# Altium schematic sheet Input Stage.SchDoc
size A4; SheetNumber: 1; SheetTotal: 4
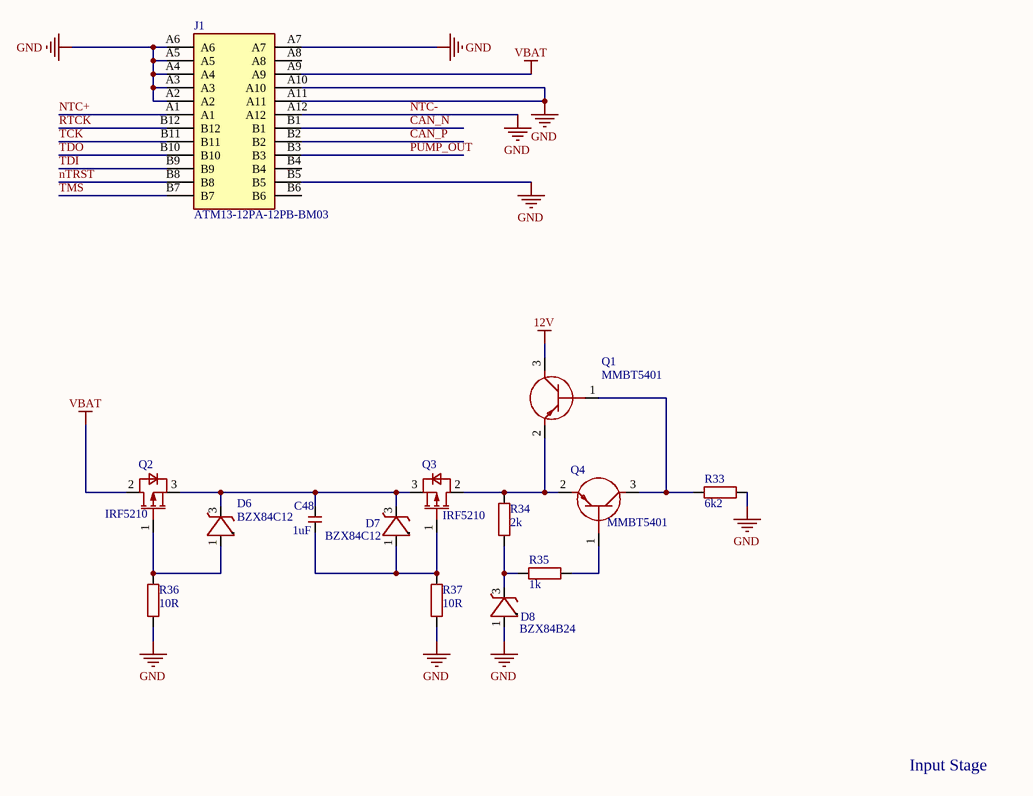
[diagram p0: Input Stage.SchDoc]

## Parts
C48  1uF  [C0402]
D6  BZX84C12  [SOT96P237X111-3N]
D7  BZX84C12  [SOT96P237X111-3N]
D8  BZX84B24  [TRANS_BZX84_ROM-M]
J1  ATM13-12PA-12PB-BM03  [ATM1312PA12PBBM03]
Q1  MMBT5401  [SOT95P240X120-3N]
Q2  IRF5210  [TO254P1528X508-4_3N-V1]
Q3  IRF5210  [TO254P1528X508-4_3N-V1]
Q4  MMBT5401  [SOT95P240X120-3N]
R33  6k2  [R0402]
R34  2k  [R0402]
R35  1k  [R0402]
R36  10R  [R0402]
R37  10R  [R0402]

## Nets
12V: Q1.3(C)
GND: D8.1(A) J1.A2 J1.A3 J1.A4 J1.A5 J1.A6 J1.A7 J1.A10 J1.A11 J1.A12 J1.B5 R33.2 R36.1 R37.1
VBAT: J1.A9 Q2.2(DRAIN)
CAN_N: J1.B1
CAN_P: J1.B2
NTC+: J1.A1
nTRST: J1.B8
PUMP_OUT: J1.B3
RTCK: J1.B12
TCK: J1.B11
TDI: J1.B9
TDO: J1.B10
TMS: J1.B7
NetC48_1: C48.1 D7.1(A) Q3.1(GATE) R37.2
NetC48_2: C48.2 D6.3(K) D7.3(K) Q2.3(SOURCE) Q3.3(SOURCE)
NetD6_1: D6.1(A) Q2.1(GATE) R36.2
NetD8_3: D8.3(K) R34.1 R35.1
NetQ1_1: Q1.1(B) Q4.3(C) R33.1
NetQ1_2: Q1.2(E) Q3.2(DRAIN) Q4.2(E) R34.2
NetQ4_1: Q4.1(B) R35.2

Not connected (* = marked no-connect by the designer): D6 2(NC); D7 2(NC); D8 2(NC); J1 A8 B4 B6

## Notes on the sheet
- NTC-
- Input Stage

## Library data of the parts
C48 = C0402C105K4PAC7411: Ceramic Capacitor, Multilayer, Ceramic, 16V, 10% +Tol, 10% -Tol, X5R, 15% TC, 1uF, Surface Mount, 0402; Manufacturer: KEMET; Multilayer: Yes; Supplier: Mouser; Supplier Part Number: 80-C0402C105K4P7411; Manufacturer Part Number: C0402C105K4PAC7411; RoHS: Yes; Category: Ceramic Capacitors; Stock: 78488; Pricing: 1=0.11, 10=0.061, 50=0.061, 100=0.037, 1000=0.024, 10000=0.019 (USD); Mounting Technology: Surface Mount; Pins: 2; Dielectric Material: Ceramic; Package Shape: Rectangular; Case/Package: 0402; Min Operating Temperature: -55°C; Max Operating Temperature: 85°C; Value: 1uF; Capacitor Type: Ceramic; Tolerance  (fill in as +-): 10%; Packaging: Tape and Reel; Tolerance (fill in as +-): 10%; Rated DC Voltage (URdc): 16V; Temperature Characteristics Code: X5R; Termination: Wraparound; Reach SVHC Compliant: Yes; RoHS Compliant: Yes; ComponentLink1URL: https://datasheet.ciiva.com:443/pdfs/VipMasterIC/IC/KEME/KEME-S-A0008991665/KEME-S-A0008991665-1.pdf?src-supplier=IHS+Markit; ComponentLink1Description: https://datasheet.ciiva.com:443/pdfs/VipMasterIC/IC/KEME/KEME-S-A0008991665/KEME-S-A0008991665-1.pdf?src-supplier=IHS+Markit; ComponentLink2URL: https://api.kemet.com/component-edge/download/datasheet/C0402C105K4PAC7411.pdf?src-supplier=Digikey; ComponentLink2Description: https://api.kemet.com/component-edge/download/datasheet/C0402C105K4PAC7411.pdf?src-supplier=Digikey; ComponentLink3URL: https://datasheet.octopart.com/C0402C105K4PAC7411-KEMET-datasheet-142027389.pdf?src-supplier=Farnell; ComponentLink3Description: https://datasheet.octopart.com/C0402C105K4PAC7411-KEMET-datasheet-142027389.pdf?src-supplier=Farnell
D6 D7 = BZX84C12LT1G: Zener Diode, 12V V(Z), 5.39%, 0.25W, Silicon, Unidirectional, TO-236AB; Manufacturer: ON Semiconductor; Package Body Material: Plastic; Dynamic Impedance-Max: 25R; Number of Elements: 1; Max Power Dissipation: 250mW; Test Current: 5mA; Additional Feature: UL RECOGNIZED; Time @ Peak Reflow Temperature-Max (s): 40s; Qualification Status: Not Qualified; Supplier: Mouser; Supplier Part Number: 863-BZX84C12LT1G; Manufacturer Part Number: BZX84C12LT1G; RoHS: Yes; Category: Zener Diodes; Stock: 46689; Pricing: 1=0.1, 10=0.057, 50=0.057, 100=0.027, 1000=0.026, 10000=0.012 (USD); Pins: 3; Diode Element Material: SILICON; Package Shape: Rectangular; Terminal Finish: Tin; Min Operating Temperature: -65°C; Max Operating Temperature: 150°C; Diode Type: ZENER; Reference Voltage-Nom: 12V; Surface Mount: Yes; Voltage Tol-Max: 5.39%; JESD-609 Code: e3; Polarity: Unidirectional; JESD-30 Code: R-PDSO-G3; Moisture Sensitivity Level: 1; Package Style: SMALL OUTLINEMeter; Technology: ZENER; Terminal Form: Gull Wing; Terminal Position: DUAL; Peak Reflow Temperature (Cel): 260°C; RoHS Compliant: Yes; Reach SVHC Compliant: Yes; JEDEC-95 Code: TO-236AB; ComponentLink1URL: https://datasheet.ciiva.com:443/pdfs/VipMasterIC/IC/ONSM/ONSM-S-A0002809012/ONSM-S-A0002809012-1.pdf?src-supplier=IHS+Markit; ComponentLink1Description: https://datasheet.ciiva.com:443/pdfs/VipMasterIC/IC/ONSM/ONSM-S-A0002809012/ONSM-S-A0002809012-1.pdf?src-supplier=IHS+Markit; ComponentLink2URL: https://datasheet.ciiva.com/39121/2010827-39121645.pdf?src-supplier=Jameco; ComponentLink2Description: https://datasheet.ciiva.com/39121/2010827-39121645.pdf?src-supplier=Jameco; ComponentLink3URL: https://datasheet.ciiva.com/15141/getdatasheetpartid-38645-15141985.pdf?src-supplier=Verical; ComponentLink3Description: https://datasheet.ciiva.com/15141/getdatasheetpartid-38645-15141985.pdf?src-supplier=Verical; ComponentLink4URL: https://datasheet.ciiva.com/8026/bzx84c2v4lt1-d-8026969.pdf?src-supplier=Element14; ComponentLink4Description: https://datasheet.ciiva.com/8026/bzx84c2v4lt1-d-8026969.pdf?src-supplier=Element14; ComponentLink5URL: https://datasheet.ciiva.com/8026/bzx84c2v4lt1-d-8026970.pdf?src-supplier=Element14; ComponentLink5Description: https://datasheet.ciiva.com/8026/bzx84c2v4lt1-d-8026970.pdf?src-supplier=Element14; ComponentLink6URL: https://datasheet.ciiva.com/18434/70100187-18434894.pdf?src-supplier=Allied+Electronics; ComponentLink6Description: https://datasheet.ciiva.com/18434/70100187-18434894.pdf?src-supplier=Allied+Electronics; ComponentLink7URL: https://datasheet.ciiva.com/8345/bzx84c2v4lt1-d-8345784.pdf?src-supplier=Avnet; ComponentLink7Description: https://datasheet.ciiva.com/8345/bzx84c2v4lt1-d-8345784.pdf?src-supplier=Avnet; ComponentLink8URL: https://datasheet.ciiva.com/8345/bzx84c2v4lt1-d-8345788.pdf?src-supplier=Avnet; ComponentLink8Description: https://datasheet.ciiva.com/8345/bzx84c2v4lt1-d-8345788.pdf?src-supplier=Avnet; ComponentLink9URL: https://datasheet.ciiva.com/894/bzx84c2v4lt1-d-894702.pdf?src-supplier=Digikey; ComponentLink9Description: https://datasheet.ciiva.com/894/bzx84c2v4lt1-d-894702.pdf?src-supplier=Digikey; ComponentLink10URL: https://datasheet.ciiva.com/894/bzx84c2v4lt1-d-894703.pdf?src-supplier=Digikey; ComponentLink10Description: https://datasheet.ciiva.com/894/bzx84c2v4lt1-d-894703.pdf?src-supplier=Digikey; ComponentLink11URL: https://datasheet.ciiva.com/894/bzx84c2v4lt1-d-894701.pdf?src-supplier=Digikey; ComponentLink11Description: https://datasheet.ciiva.com/894/bzx84c2v4lt1-d-894701.pdf?src-supplier=Digikey
D8 = BZX84B24VLFHT116: Zener Diode, 24V V(Z), 2.08%, 0.25W, Silicon, Unidirectional
J1 = ATM13-12PA-12PB-BM03: AMPHENOL SINE/TUCHEL - ATM13-12PA-12PB-BM03 - ATM HEADER  (2) 12 POSITION SIZE 20, A&B KEY  - TIN PLATING 98AC7190; Geometry.Height: 35.4mm; Manufacturer_Name: Amphenol; Manufacturer_Part_Number: ATM13-12PA-12PB-BM03; Mouser Part Number: 654-ATM1312A12PBBM03; Mouser Price/Stock: https://www.mouser.co.uk/ProductDetail/Amphenol-SINE-Systems/ATM13-12PA-12PB-BM03?qs=9r4v7xj2Lnmhl8rtozcZiQ%3D%3D; Arrow Part Number: ATM13-12PA-12PB-BM03; Arrow Price/Stock: https://www.arrow.com/en/products/atm13-12pa-12pb-bm03/amphenol?region=nac; Datasheet Link: http://www.amphenol-sine.com/pdf/datasheet/ATM13-12PA-12PB-BM03.pdf
Q1 Q4 = MMBT5401: Small Signal Bipolar Transistor, 0.6A I(C), 150V V(BR)CEO, 1-Element, PNP, Silicon, TO-236; Manufacturer: Diotec; Package Body Material: Plastic; Max Collector Current: 600mA; DC Current Gain-Min (hFE): 50; Number of Elements: 1; Frequency: 100MHz; Qualification Status: Not Qualified; Supplier: Mouser; Supplier Part Number: 637-MMBT5401; Manufacturer Part Number: MMBT5401; RoHS: Yes; Category: BJTs; Stock: 892; Pricing: 1=0.12, 10=0.064, 50=0.064, 100=0.042, 1000=0.03, 10000=0.015 (USD); Pins: 3; Package Shape: Rectangular; Transistor Element Material: SILICON; Max Operating Temperature: 150°C; Polarity/Channel Type: PNP; Collector-emitter Voltage-Max: 150V; JESD-30 Code: R-PDSO-G3; Moisture Sensitivity Level: 1; Package Style: SMALL OUTLINEMeter; Peak Reflow Temperature (Cel): 260°C; Surface Mount: Yes; Terminal Form: Gull Wing; Terminal Position: DUAL; JEDEC-95 Code: TO-236; Reach SVHC Compliant: Yes; RoHS Compliant: Yes; ComponentLink1URL: https://datasheet.ciiva.com:443/pdfs/VipMasterIC/IC/DISE/DISE-S-A0006087454/DISE-S-A0006087454-1.pdf?src-supplier=IHS+Markit; ComponentLink1Description: https://datasheet.ciiva.com:443/pdfs/VipMasterIC/IC/DISE/DISE-S-A0006087454/DISE-S-A0006087454-1.pdf?src-supplier=IHS+Markit; ComponentLink2URL: http://datasheet.octopart.com/MMBT5401-Diotec-datasheet-20771873.pdf?src-supplier=Mouser; ComponentLink2Description: http://datasheet.octopart.com/MMBT5401-Diotec-datasheet-20771873.pdf?src-supplier=Mouser; ComponentLink3URL: http://datasheet.octopart.com/MMBT5401-Diotec-datasheet-20771873.pdf?src-supplier=Distrelec; ComponentLink3Description: http://datasheet.octopart.com/MMBT5401-Diotec-datasheet-20771873.pdf?src-supplier=Distrelec; ComponentLink4URL: http://datasheet.octopart.com/MMBT5401-Diotec-datasheet-20771873.pdf?src-supplier=Arrow+Electronics; ComponentLink4Description: http://datasheet.octopart.com/MMBT5401-Diotec-datasheet-20771873.pdf?src-supplier=Arrow+Electronics; ComponentLink5URL: http://datasheet.octopart.com/MMBT5401-Diotec-datasheet-20771873.pdf?src-supplier=Verical; ComponentLink5Description: http://datasheet.octopart.com/MMBT5401-Diotec-datasheet-20771873.pdf?src-supplier=Verical; ComponentLink6URL: http://datasheet.octopart.com/MMBT5401-Diotec-datasheet-20771873.pdf?src-supplier=Onlinecomponents.com; ComponentLink6Description: http://datasheet.octopart.com/MMBT5401-Diotec-datasheet-20771873.pdf?src-supplier=Onlinecomponents.com; ComponentLink7URL: http://datasheet.octopart.com/MMBT5401-Diotec-datasheet-20771873.pdf?src-supplier=LCSC; ComponentLink7Description: http://datasheet.octopart.com/MMBT5401-Diotec-datasheet-20771873.pdf?src-supplier=LCSC; ComponentLink8URL: https://datasheet.octopart.com/MMBT5401-Diotec-datasheet-116330324.pdf?src-supplier=TME; ComponentLink8Description: https://datasheet.octopart.com/MMBT5401-Diotec-datasheet-116330324.pdf?src-supplier=TME; ComponentLink9URL: http://datasheet.octopart.com/MMBT5401-Diotec-datasheet-20771873.pdf?src-supplier=ComS.I.T.; ComponentLink9Description: http://datasheet.octopart.com/MMBT5401-Diotec-datasheet-20771873.pdf?src-supplier=ComS.I.T.; ComponentLink10URL: http://datasheet.octopart.com/MMBT5401-Diotec-datasheet-20771873.pdf?src-supplier=DComponents; ComponentLink10Description: http://datasheet.octopart.com/MMBT5401-Diotec-datasheet-20771873.pdf?src-supplier=DComponents; ComponentLink11URL: http://datasheet.octopart.com/MMBT5401-Diotec-datasheet-20771873.pdf?src-supplier=Electro+Sonic; ComponentLink11Description: http://datasheet.octopart.com/MMBT5401-Diotec-datasheet-20771873.pdf?src-supplier=Electro+Sonic
Q2 Q3 = IRF5210STRLPBF: Zener Diode, 24V V(Z), 2.08%, 0.25W, Silicon, Unidirectional; Manufacturer: Infineon; Package Body Material: Plastic; Polarity/Channel Type: P-CHANNEL; Avalanche Energy Rating (Eas): 120mJ; Case Connection: DRAIN; Drain Current-Max (ID): 38A; Drain-source On Resistance-Max: 60mR; DS Breakdown Voltage-Min: 100V; FET Technology: METAL-OXIDE SEMICONDUCTOR; Number of Elements: 1; Operating Mode: ENHANCEMENT MODE; Pulsed Drain Current-Max (IDM): 140A; Transistor Application: SWITCHING; Time @ Peak Reflow Temperature-Max (s): 30s; Power Dissipation-Max (Abs): 170W; JEDEC-95 Code: TO-263AB; Qualification Status: Not Qualified; Supplier: Mouser; Supplier Part Number: 942-IRF5210STRLPBF; Manufacturer Part Number: IRF5210STRLPBF; RoHS: Yes; Category: MOSFETs; Stock: 11429; Pricing: 1=3.62, 10=1.73, 50=1.69, 100=1.69, 1000=1.33, 10000=1.33 (USD); Pins: 2; Package Shape: Rectangular; Transistor Element Material: SILICON; Terminal Finish: Nickel; Max Operating Temperature: 150°C; JESD-30 Code: R-PSSO-G2; Package Style: SMALL OUTLINEMeter; Surface Mount: Yes; Terminal Form: Gull Wing; Terminal Position: SINGLE; JESD-609 Code: e3; Moisture Sensitivity Level: 1; Peak Reflow Temperature (Cel): 260°C; Drain Current-Max (Abs) (ID): 38A; RoHS Compliant: Yes; Reach SVHC Compliant: No; ComponentLink1URL: https://datasheet.ciiva.com:443/pdfs/VipMasterIC/IC/IRSD/IRSDS18784/IRSDS18784-1.pdf?src-supplier=IHS+Markit; ComponentLink1Description: https://datasheet.ciiva.com:443/pdfs/VipMasterIC/IC/IRSD/IRSDS18784/IRSDS18784-1.pdf?src-supplier=IHS+Markit; Diode Type: ZENER; ComponentLink2URL: https://datasheet.ciiva.com:443/pdfs/VipMasterIC/IC/ROHM/ROHM-S-A0007698973/ROHM-S-A0007882604-1.pdf?src-supplier=IHS+Markit; ComponentLink2Description: https://datasheet.ciiva.com:443/pdfs/VipMasterIC/IC/ROHM/ROHM-S-A0007698973/ROHM-S-A0007882604-1.pdf?src-supplier=IHS+Markit; ComponentLink3URL: https://www.rohm.com/datasheet/BZX84B24VLFH/bzx84b24vlfht116-e?src-supplier=Digikey; ComponentLink3Description: https://www.rohm.com/datasheet/BZX84B24VLFH/bzx84b24vlfht116-e?src-supplier=Digikey
R33 = AC0402FR-076K2L: Fixed Resistor, Metal Glaze/thick Film, 0.0625W, 6200ohm, 50V, 1% +/-Tol, 100ppm/Cel, Surface Mount, 0402; Manufacturer: Yageo; Additional Feature: LASER TRIMMABLE; Power: 62.5mW; Rated Temperature: 70°C; Value: 6.2kR; Temperature Coefficient (ppm/Cel): 100; Package Height: 0.32mm; Package Length: 1mm; Package Width: 0.5mm; Reference Standard: AEC-Q200; Supplier: Mouser; Supplier Part Number: 603-AC0402FR-076K2L; Manufacturer Part Number: AC0402FR-076K2L; RoHS: Yes; Category: Chip SMD Resistors; Stock: 418682; Pricing: 1=0.1, 10=0.009, 50=0.009, 100=0.007, 1000=0.006, 10000=0.002 (USD); Mounting Technology: Surface Mount; Pins: 2; Package Shape: Rectangular; Case/Package: 0402; Terminal Finish: Nickel; Min Operating Temperature: -55°C; Max Operating Temperature: 155°C; Tolerance: 1%; JESD-609 Code: e3; Resistor Type: FIXED RESISTOR; Construction: Chip; Packaging: Tape and Reel; Technology: METAL GLAZE/THICK FILM; Termination: Wraparound; Working Voltage: 50V; Reach SVHC Compliant: Yes; RoHS Compliant: Yes; ComponentLink1URL: https://datasheet.ciiva.com:443/pdfs/VipMasterIC/IC/YAGO/YAGO-S-A0003597364/YAGO-S-A0003597364-1.pdf?src-supplier=IHS+Markit; ComponentLink1Description: https://datasheet.ciiva.com:443/pdfs/VipMasterIC/IC/YAGO/YAGO-S-A0003597364/YAGO-S-A0003597364-1.pdf?src-supplier=IHS+Markit; ComponentLink2URL: https://datasheet.octopart.com/AC0402FR-076K2L-Yageo-datasheet-151884373.pdf?src-supplier=Future+Electronics; ComponentLink2Description: https://datasheet.octopart.com/AC0402FR-076K2L-Yageo-datasheet-151884373.pdf?src-supplier=Future+Electronics; ComponentLink3URL: http://www.yageo.com/NewPortal/yageodocoutput?fileName=/pdf/R-Chip/PYu-AC_51_RoHS_L_6.pdf&src-supplier=Digikey; ComponentLink3Description: http://www.yageo.com/NewPortal/yageodocoutput?fileName=/pdf/R-Chip/PYu-AC_51_RoHS_L_6.pdf&src-supplier=Digikey; ComponentLink4URL: https://www.yageo.com/upload/media/product/productsearch/datasheet/rchip/PYu-AC_51_RoHS_L_7.pdf?src-supplier=Digikey; ComponentLink4Description: https://www.yageo.com/upload/media/product/productsearch/datasheet/rchip/PYu-AC_51_RoHS_L_7.pdf?src-supplier=Digikey; ComponentLink5URL: http://www.yageo.com/documents/recent/PYu-AC_51_RoHS_L_2_revised.pdf?src-supplier=Future+Electronics; ComponentLink5Description: http://www.yageo.com/documents/recent/PYu-AC_51_RoHS_L_2_revised.pdf?src-supplier=Future+Electronics
R34 = RC0402JR-072KP: Fixed Resistor, Metal Glaze/thick Film, 0.0625W, 2000ohm, 50V, 5% +/-Tol, 150ppm/Cel, Surface Mount, 0402; Manufacturer: Yageo; Supplier: Mouser; Supplier Part Number: 603-RC0402JR-072KP; Manufacturer Part Number: RC0402JR-072KP; RoHS: Yes; Category: Uncategorized; Stock: 28128; Pricing: 1=0.2, 10=0.02, 50=0.02, 100=0.013, 1000=0.011, 10000=0.005 (USD)
R35 = RT0402FRE101KL: Fixed Resistor, Thin Film, 0.0625W, 1000ohm, 50V, 1% +/-Tol, 50ppm/Cel, Surface Mount, 0402; Manufacturer: Yageo; Supplier: Mouser; Supplier Part Number: 603-RT0402FRE101KL; Manufacturer Part Number: RT0402FRE101KL; RoHS: Yes; Category: Chip SMD Resistors; Stock: 2470; Pricing: 1=0.1, 10=0.026, 50=0.026, 100=0.02, 1000=0.015, 10000=0.01 (USD); Reach SVHC Compliant: Yes; RoHS Compliant: Yes
R36 R37 = AC0402FR-1010RL: Fixed Resistor, Metal Glaze/thick Film, 0.0625W, 10ohm, 50V, 1% +/-Tol, 200ppm/Cel, Surface Mount, 0402; Manufacturer: Yageo; Additional Feature: LASER TRIMMABLE; Power: 62.5mW; Rated Temperature: 70°C; Temperature Coefficient (ppm/Cel): 200; Package Height: 0.32mm; Package Length: 1mm; Package Width: 0.5mm; Reference Standard: AEC-Q200; Supplier: Mouser; Supplier Part Number: 603-AC0402FR-1010RL; Manufacturer Part Number: AC0402FR-1010RL; RoHS: Yes; Category: Chip SMD Resistors; Stock: 136743; Pricing: 1=0.18, 10=0.018, 50=0.018, 100=0.012, 1000=0.01, 10000=0.005 (USD); Mounting Technology: Surface Mount; Pins: 2; Package Shape: Rectangular; Case/Package: 0402; Terminal Finish: Nickel; Min Operating Temperature: -55°C; Max Operating Temperature: 155°C; Tolerance: 1%; JESD-609 Code: e3; Resistor Type: FIXED RESISTOR; Construction: Chip; Packaging: Tape and Reel; Value: 10R; Technology: METAL GLAZE/THICK FILM; Termination: Wraparound; Working Voltage: 50V; Reach SVHC Compliant: Yes; RoHS Compliant: Yes; ComponentLink1URL: https://datasheet.ciiva.com:443/pdfs/VipMasterIC/IC/YAGO/YAGO-S-A0003597364/YAGO-S-A0003597364-1.pdf?src-supplier=IHS+Markit; ComponentLink1Description: https://datasheet.ciiva.com:443/pdfs/VipMasterIC/IC/YAGO/YAGO-S-A0003597364/YAGO-S-A0003597364-1.pdf?src-supplier=IHS+Markit